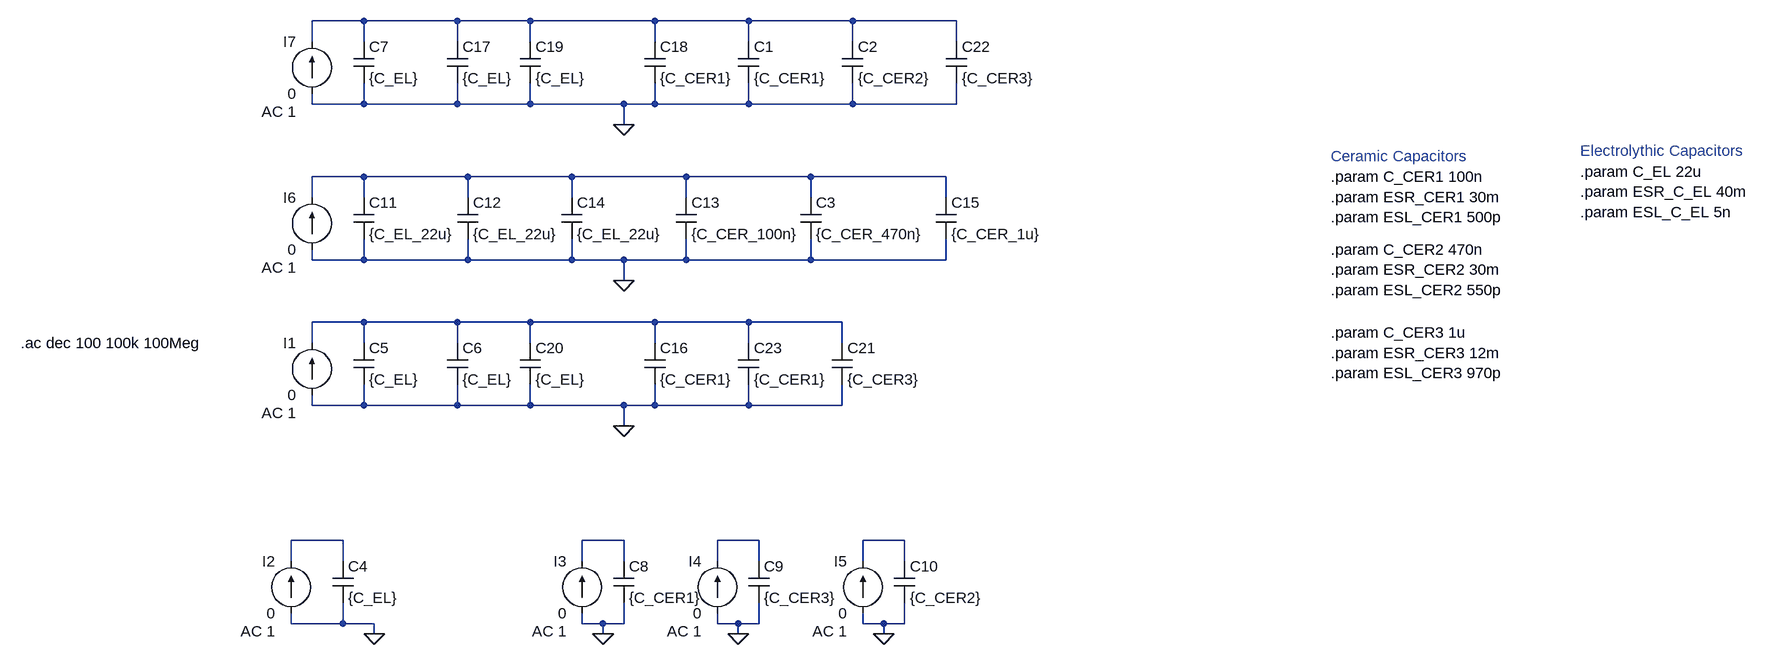
[diagram p0: schematic capacitor_stack_output100V.asc]
capacitor_stack_output100V.asc, the LTspice schematic file:
Version 4.1
SHEET 1 2704 820
WIRE 80 -144 0 -144
WIRE 224 -144 80 -144
WIRE 336 -144 224 -144
WIRE 528 -144 336 -144
WIRE 672 -144 528 -144
WIRE 832 -144 672 -144
WIRE 992 -144 832 -144
WIRE 0 -112 0 -144
WIRE 80 -112 80 -144
WIRE 224 -112 224 -144
WIRE 336 -112 336 -144
WIRE 528 -112 528 -144
WIRE 672 -112 672 -144
WIRE 832 -112 832 -144
WIRE 992 -112 992 -144
WIRE 0 -16 0 -32
WIRE 80 -16 80 -48
WIRE 80 -16 0 -16
WIRE 224 -16 224 -48
WIRE 224 -16 80 -16
WIRE 336 -16 336 -48
WIRE 336 -16 224 -16
WIRE 480 -16 336 -16
WIRE 528 -16 528 -48
WIRE 528 -16 480 -16
WIRE 672 -16 672 -48
WIRE 672 -16 528 -16
WIRE 832 -16 832 -48
WIRE 832 -16 672 -16
WIRE 992 -16 992 -48
WIRE 992 -16 832 -16
WIRE 480 16 480 -16
WIRE 80 96 0 96
WIRE 240 96 80 96
WIRE 400 96 240 96
WIRE 576 96 400 96
WIRE 768 96 576 96
WIRE 976 96 768 96
WIRE 0 128 0 96
WIRE 80 128 80 96
WIRE 240 128 240 96
WIRE 400 128 400 96
WIRE 576 128 576 96
WIRE 768 128 768 96
WIRE 976 128 976 96
WIRE 0 224 0 208
WIRE 80 224 80 192
WIRE 80 224 0 224
WIRE 240 224 240 192
WIRE 240 224 80 224
WIRE 400 224 400 192
WIRE 400 224 240 224
WIRE 480 224 400 224
WIRE 576 224 576 192
WIRE 576 224 480 224
WIRE 768 224 768 192
WIRE 768 224 576 224
WIRE 976 224 976 192
WIRE 976 224 768 224
WIRE 480 256 480 224
WIRE 80 320 0 320
WIRE 224 320 80 320
WIRE 336 320 224 320
WIRE 528 320 336 320
WIRE 672 320 528 320
WIRE 816 320 672 320
WIRE 0 352 0 320
WIRE 80 352 80 320
WIRE 224 352 224 320
WIRE 336 352 336 320
WIRE 528 352 528 320
WIRE 672 352 672 320
WIRE 816 352 816 320
WIRE 0 448 0 432
WIRE 80 448 80 416
WIRE 80 448 0 448
WIRE 224 448 224 416
WIRE 224 448 80 448
WIRE 336 448 336 416
WIRE 336 448 224 448
WIRE 480 448 336 448
WIRE 528 448 528 416
WIRE 528 448 480 448
WIRE 672 448 672 416
WIRE 672 448 528 448
WIRE 816 448 816 416
WIRE 816 448 672 448
WIRE 480 480 480 448
WIRE 48 656 -32 656
WIRE 480 656 416 656
WIRE 688 656 624 656
WIRE 912 656 848 656
WIRE -32 688 -32 656
WIRE 48 688 48 656
WIRE 416 688 416 656
WIRE 480 688 480 656
WIRE 624 688 624 656
WIRE 688 688 688 656
WIRE 848 688 848 656
WIRE 912 688 912 656
WIRE -32 784 -32 768
WIRE 48 784 48 752
WIRE 48 784 -32 784
WIRE 96 784 48 784
WIRE 416 784 416 768
WIRE 448 784 416 784
WIRE 480 784 480 752
WIRE 480 784 448 784
WIRE 624 784 624 768
WIRE 656 784 624 784
WIRE 688 784 688 752
WIRE 688 784 656 784
WIRE 848 784 848 768
WIRE 880 784 848 784
WIRE 912 784 912 752
WIRE 912 784 880 784
WIRE 96 800 96 784
WIRE 448 800 448 784
WIRE 656 800 656 784
WIRE 880 800 880 784
FLAG 96 800 0
FLAG 448 800 0
FLAG 656 800 0
FLAG 880 800 0
FLAG 480 256 0
FLAG 480 16 0
FLAG 480 480 0
SYMBOL cap 32 688 R0
SYMATTR InstName C4
SYMATTR Value {C_EL}
SYMATTR SpiceLine Rser={ESR_C_EL} Lser={ESL_C_EL}
SYMBOL current -32 768 R180
WINDOW 0 24 80 Left 2
WINDOW 3 24 0 Left 2
WINDOW 123 24 -28 Left 2
WINDOW 39 0 0 Left 0
SYMATTR InstName I2
SYMATTR Value 0
SYMATTR Value2 AC 1
SYMBOL cap 464 688 R0
SYMATTR InstName C8
SYMATTR Value {C_CER1}
SYMATTR SpiceLine Rser={ESR_CER1} Lser={ESL_CER1}
SYMBOL current 416 768 R180
WINDOW 0 24 80 Left 2
WINDOW 3 24 0 Left 2
WINDOW 123 24 -28 Left 2
WINDOW 39 0 0 Left 0
SYMATTR InstName I3
SYMATTR Value 0
SYMATTR Value2 AC 1
SYMBOL current 624 768 R180
WINDOW 0 24 80 Left 2
WINDOW 3 24 0 Left 2
WINDOW 123 24 -28 Left 2
WINDOW 39 0 0 Left 0
SYMATTR InstName I4
SYMATTR Value 0
SYMATTR Value2 AC 1
SYMBOL current 848 768 R180
WINDOW 0 24 80 Left 2
WINDOW 3 24 0 Left 2
WINDOW 123 24 -28 Left 2
WINDOW 39 0 0 Left 0
SYMATTR InstName I5
SYMATTR Value 0
SYMATTR Value2 AC 1
SYMBOL cap 672 688 R0
SYMATTR InstName C9
SYMATTR Value {C_CER3}
SYMATTR SpiceLine Rser={ESR_CER3} Lser={ESL_CER3}
SYMBOL cap 896 688 R0
SYMATTR InstName C10
SYMATTR Value {C_CER2}
SYMATTR SpiceLine Rser={ESR_CER2} Lser={ESL_CER2}
SYMBOL cap 64 128 R0
SYMATTR InstName C11
SYMATTR Value {C_EL_22u}
SYMATTR SpiceLine Rser={ESR_C_EL} Lser={ESL_C_EL}
SYMBOL cap 560 128 R0
SYMATTR InstName C13
SYMATTR Value {C_CER_100n}
SYMATTR SpiceLine Rser={ESR_CER1} Lser={ESL_CER1}
SYMBOL current 0 208 R180
WINDOW 0 24 80 Left 2
WINDOW 3 24 0 Left 2
WINDOW 123 24 -28 Left 2
WINDOW 39 0 0 Left 0
SYMATTR InstName I6
SYMATTR Value 0
SYMATTR Value2 AC 1
SYMBOL cap 960 128 R0
SYMATTR InstName C15
SYMATTR Value {C_CER_1u}
SYMATTR SpiceLine Rser={ESR_CER3} Lser={ESL_CER3}
SYMBOL cap 64 -112 R0
SYMATTR InstName C7
SYMATTR Value {C_EL}
SYMATTR SpiceLine Rser={ESR_C_EL} Lser={ESL_C_EL}
SYMBOL cap 208 -112 R0
SYMATTR InstName C17
SYMATTR Value {C_EL}
SYMATTR SpiceLine Rser={ESR_C_EL} Lser={ESL_C_EL}
SYMBOL cap 512 -112 R0
SYMATTR InstName C18
SYMATTR Value {C_CER1}
SYMATTR SpiceLine Rser={ESR_CER1} Lser={ESL_CER1}
SYMBOL current 0 -32 R180
WINDOW 0 24 80 Left 2
WINDOW 3 24 0 Left 2
WINDOW 123 24 -28 Left 2
WINDOW 39 0 0 Left 0
SYMATTR InstName I7
SYMATTR Value 0
SYMATTR Value2 AC 1
SYMBOL cap 320 -112 R0
SYMATTR InstName C19
SYMATTR Value {C_EL}
SYMATTR SpiceLine Rser={ESR_C_EL} Lser={ESL_C_EL}
SYMBOL cap 976 -112 R0
SYMATTR InstName C22
SYMATTR Value {C_CER3}
SYMATTR SpiceLine Rser={ESR_CER3} Lser={ESL_CER3}
SYMBOL cap 656 -112 R0
SYMATTR InstName C1
SYMATTR Value {C_CER1}
SYMATTR SpiceLine Rser={ESR_CER1} Lser={ESL_CER1}
SYMBOL cap 816 -112 R0
SYMATTR InstName C2
SYMATTR Value {C_CER2}
SYMATTR SpiceLine Rser={ESR_CER2} Lser={ESL_CER2}
SYMBOL cap 752 128 R0
SYMATTR InstName C3
SYMATTR Value {C_CER_470n}
SYMATTR SpiceLine Rser={ESR_CER2} Lser={ESL_CER2}
SYMBOL cap 64 352 R0
SYMATTR InstName C5
SYMATTR Value {C_EL}
SYMATTR SpiceLine Rser={ESR_C_EL} Lser={ESL_C_EL}
SYMBOL cap 208 352 R0
SYMATTR InstName C6
SYMATTR Value {C_EL}
SYMATTR SpiceLine Rser={ESR_C_EL} Lser={ESL_C_EL}
SYMBOL cap 512 352 R0
SYMATTR InstName C16
SYMATTR Value {C_CER1}
SYMATTR SpiceLine Rser={ESR_CER1} Lser={ESL_CER1}
SYMBOL current 0 432 R180
WINDOW 0 24 80 Left 2
WINDOW 3 24 0 Left 2
WINDOW 123 24 -28 Left 2
WINDOW 39 0 0 Left 0
SYMATTR InstName I1
SYMATTR Value 0
SYMATTR Value2 AC 1
SYMBOL cap 320 352 R0
SYMATTR InstName C20
SYMATTR Value {C_EL}
SYMATTR SpiceLine Rser={ESR_C_EL} Lser={ESL_C_EL}
SYMBOL cap 800 352 R0
SYMATTR InstName C21
SYMATTR Value {C_CER3}
SYMATTR SpiceLine Rser={ESR_CER3} Lser={ESL_CER3}
SYMBOL cap 656 352 R0
SYMATTR InstName C23
SYMATTR Value {C_CER1}
SYMATTR SpiceLine Rser={ESR_CER1} Lser={ESL_CER1}
SYMBOL cap 224 128 R0
SYMATTR InstName C12
SYMATTR Value {C_EL_22u}
SYMATTR SpiceLine Rser={ESR_C_EL} Lser={ESL_C_EL}
SYMBOL cap 384 128 R0
SYMATTR InstName C14
SYMATTR Value {C_EL_22u}
SYMATTR SpiceLine Rser={ESR_C_EL} Lser={ESL_C_EL}
TEXT 1952 88 Left 2 !.param C_EL 22u\n.param ESR_C_EL 40m\n.param ESL_C_EL 5n
TEXT 1568 96 Left 2 !.param C_CER1 100n\n.param ESR_CER1 30m\n.param ESL_CER1 500p
TEXT 1568 336 Left 2 !.param C_CER3 1u\n.param ESR_CER3 12m\n.param ESL_CER3 970p
TEXT 1568 208 Left 2 !.param C_CER2 470n\n.param ESR_CER2 30m\n.param ESL_CER2 550p
TEXT 1568 64 Left 2 ;Ceramic Capacitors
TEXT 1952 56 Left 2 ;Electrolythic Capacitors
TEXT -448 352 Left 2 !.ac dec 100 100k 100Meg

The netlist it stands for:
* capacitor_stack_output100V.asc
C4 N004 0 {C_EL} Rser={ESR_C_EL} Lser={ESL_C_EL}
I2 0 N004 0 AC 1
C8 N005 0 {C_CER1} Rser={ESR_CER1} Lser={ESL_CER1}
I3 0 N005 0 AC 1
I4 0 N006 0 AC 1
I5 0 N007 0 AC 1
C9 N006 0 {C_CER3} Rser={ESR_CER3} Lser={ESL_CER3}
C10 N007 0 {C_CER2} Rser={ESR_CER2} Lser={ESL_CER2}
C11 N002 0 {C_EL_22u} Rser={ESR_C_EL} Lser={ESL_C_EL}
C13 N002 0 {C_CER_100n} Rser={ESR_CER1} Lser={ESL_CER1}
I6 0 N002 0 AC 1
C15 N002 0 {C_CER_1u} Rser={ESR_CER3} Lser={ESL_CER3}
C7 N001 0 {C_EL} Rser={ESR_C_EL} Lser={ESL_C_EL}
C17 N001 0 {C_EL} Rser={ESR_C_EL} Lser={ESL_C_EL}
C18 N001 0 {C_CER1} Rser={ESR_CER1} Lser={ESL_CER1}
I7 0 N001 0 AC 1
C19 N001 0 {C_EL} Rser={ESR_C_EL} Lser={ESL_C_EL}
C22 N001 0 {C_CER3} Rser={ESR_CER3} Lser={ESL_CER3}
C1 N001 0 {C_CER1} Rser={ESR_CER1} Lser={ESL_CER1}
C2 N001 0 {C_CER2} Rser={ESR_CER2} Lser={ESL_CER2}
C3 N002 0 {C_CER_470n} Rser={ESR_CER2} Lser={ESL_CER2}
C5 N003 0 {C_EL} Rser={ESR_C_EL} Lser={ESL_C_EL}
C6 N003 0 {C_EL} Rser={ESR_C_EL} Lser={ESL_C_EL}
C16 N003 0 {C_CER1} Rser={ESR_CER1} Lser={ESL_CER1}
I1 0 N003 0 AC 1
C20 N003 0 {C_EL} Rser={ESR_C_EL} Lser={ESL_C_EL}
C21 N003 0 {C_CER3} Rser={ESR_CER3} Lser={ESL_CER3}
C23 N003 0 {C_CER1} Rser={ESR_CER1} Lser={ESL_CER1}
C12 N002 0 {C_EL_22u} Rser={ESR_C_EL} Lser={ESL_C_EL}
C14 N002 0 {C_EL_22u} Rser={ESR_C_EL} Lser={ESL_C_EL}
.param C_EL 22u
.param ESR_C_EL 40m
.param ESL_C_EL 5n
.param C_CER1 100n
.param ESR_CER1 30m
.param ESL_CER1 500p
.param C_CER3 1u
.param ESR_CER3 12m
.param ESL_CER3 970p
.param C_CER2 470n
.param ESR_CER2 30m
.param ESL_CER2 550p
* Ceramic Capacitors
* Electrolythic Capacitors
.ac dec 100 100k 100Meg
.backanno
.end